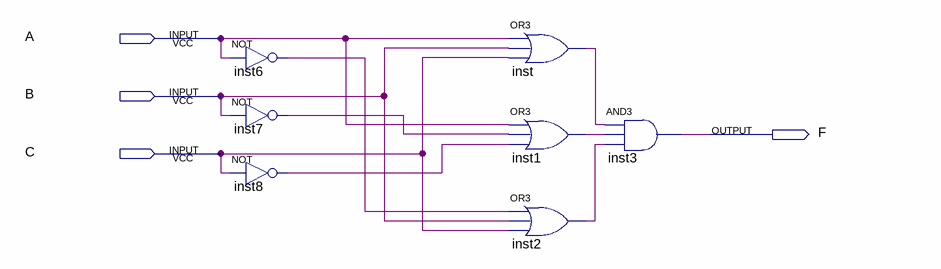
[diagram p0: schematic sheet]
// Quartus schematic pos_block.bdf as structural Verilog: 7 symbols, 4 pins
module pos_block (
  input  A,
  input  B,
  input  C,
  output F
);

  wire inst1_out, inst2_out, inst6_out, inst7_out, inst8_out, inst_out;

  not inst6 (inst6_out, A);
  not inst7 (inst7_out, B);
  not inst8 (inst8_out, C);
  or inst (inst_out, A, B, C);
  or inst1 (inst1_out, A, inst7_out, inst8_out);
  or inst2 (inst2_out, inst6_out, B, C);
  and inst3 (F, inst_out, inst1_out, inst2_out);
endmodule
